# EasyEDA Pro project reference-carrier.epro, board 扩展板
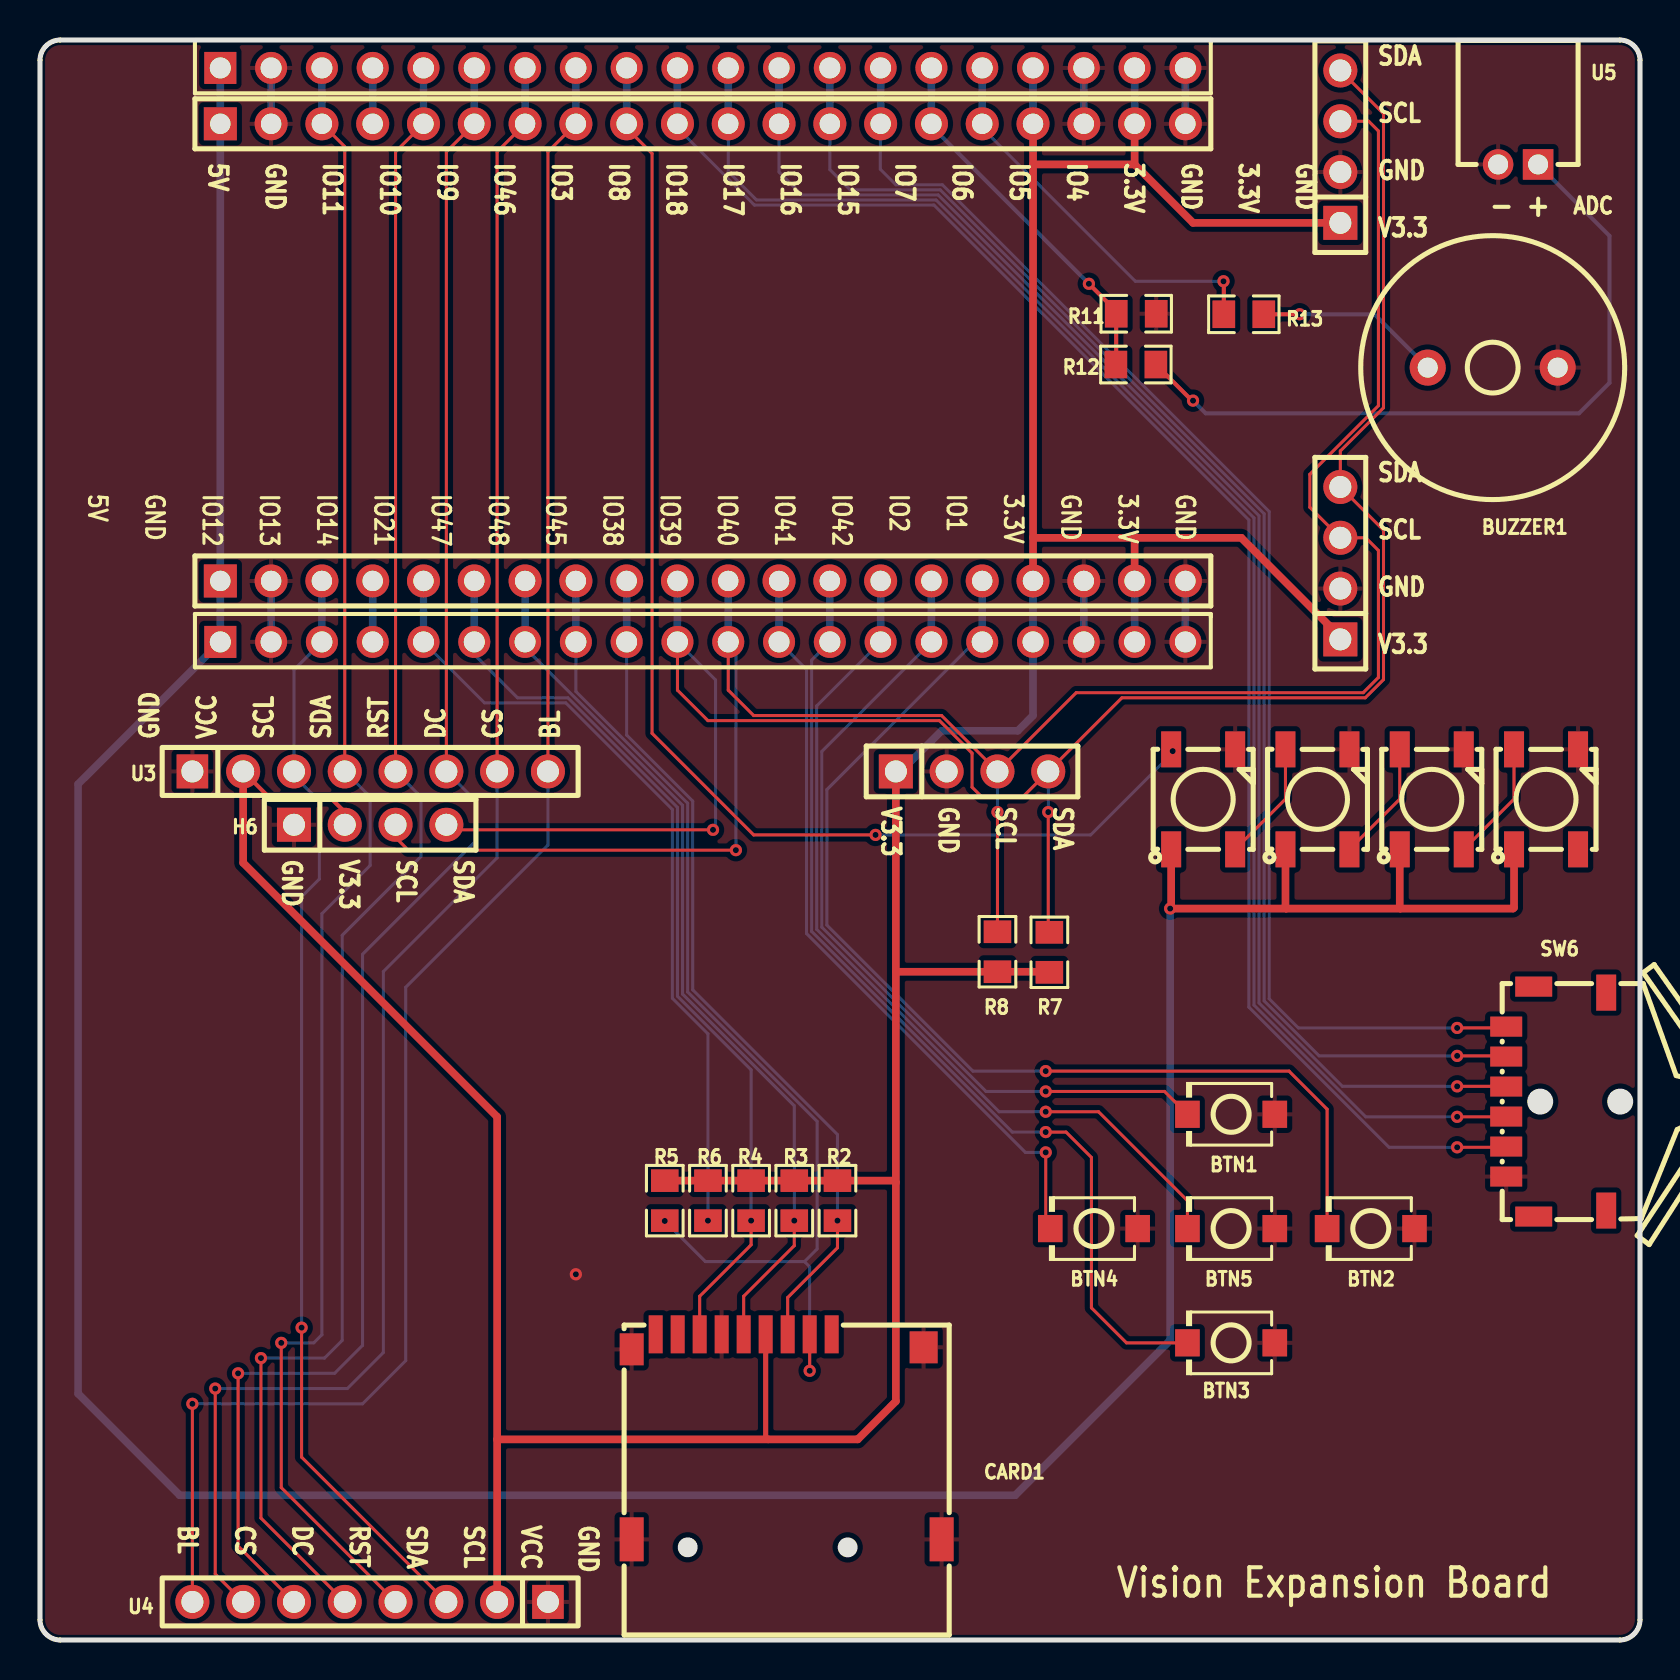
[diagram p4: board, top side]
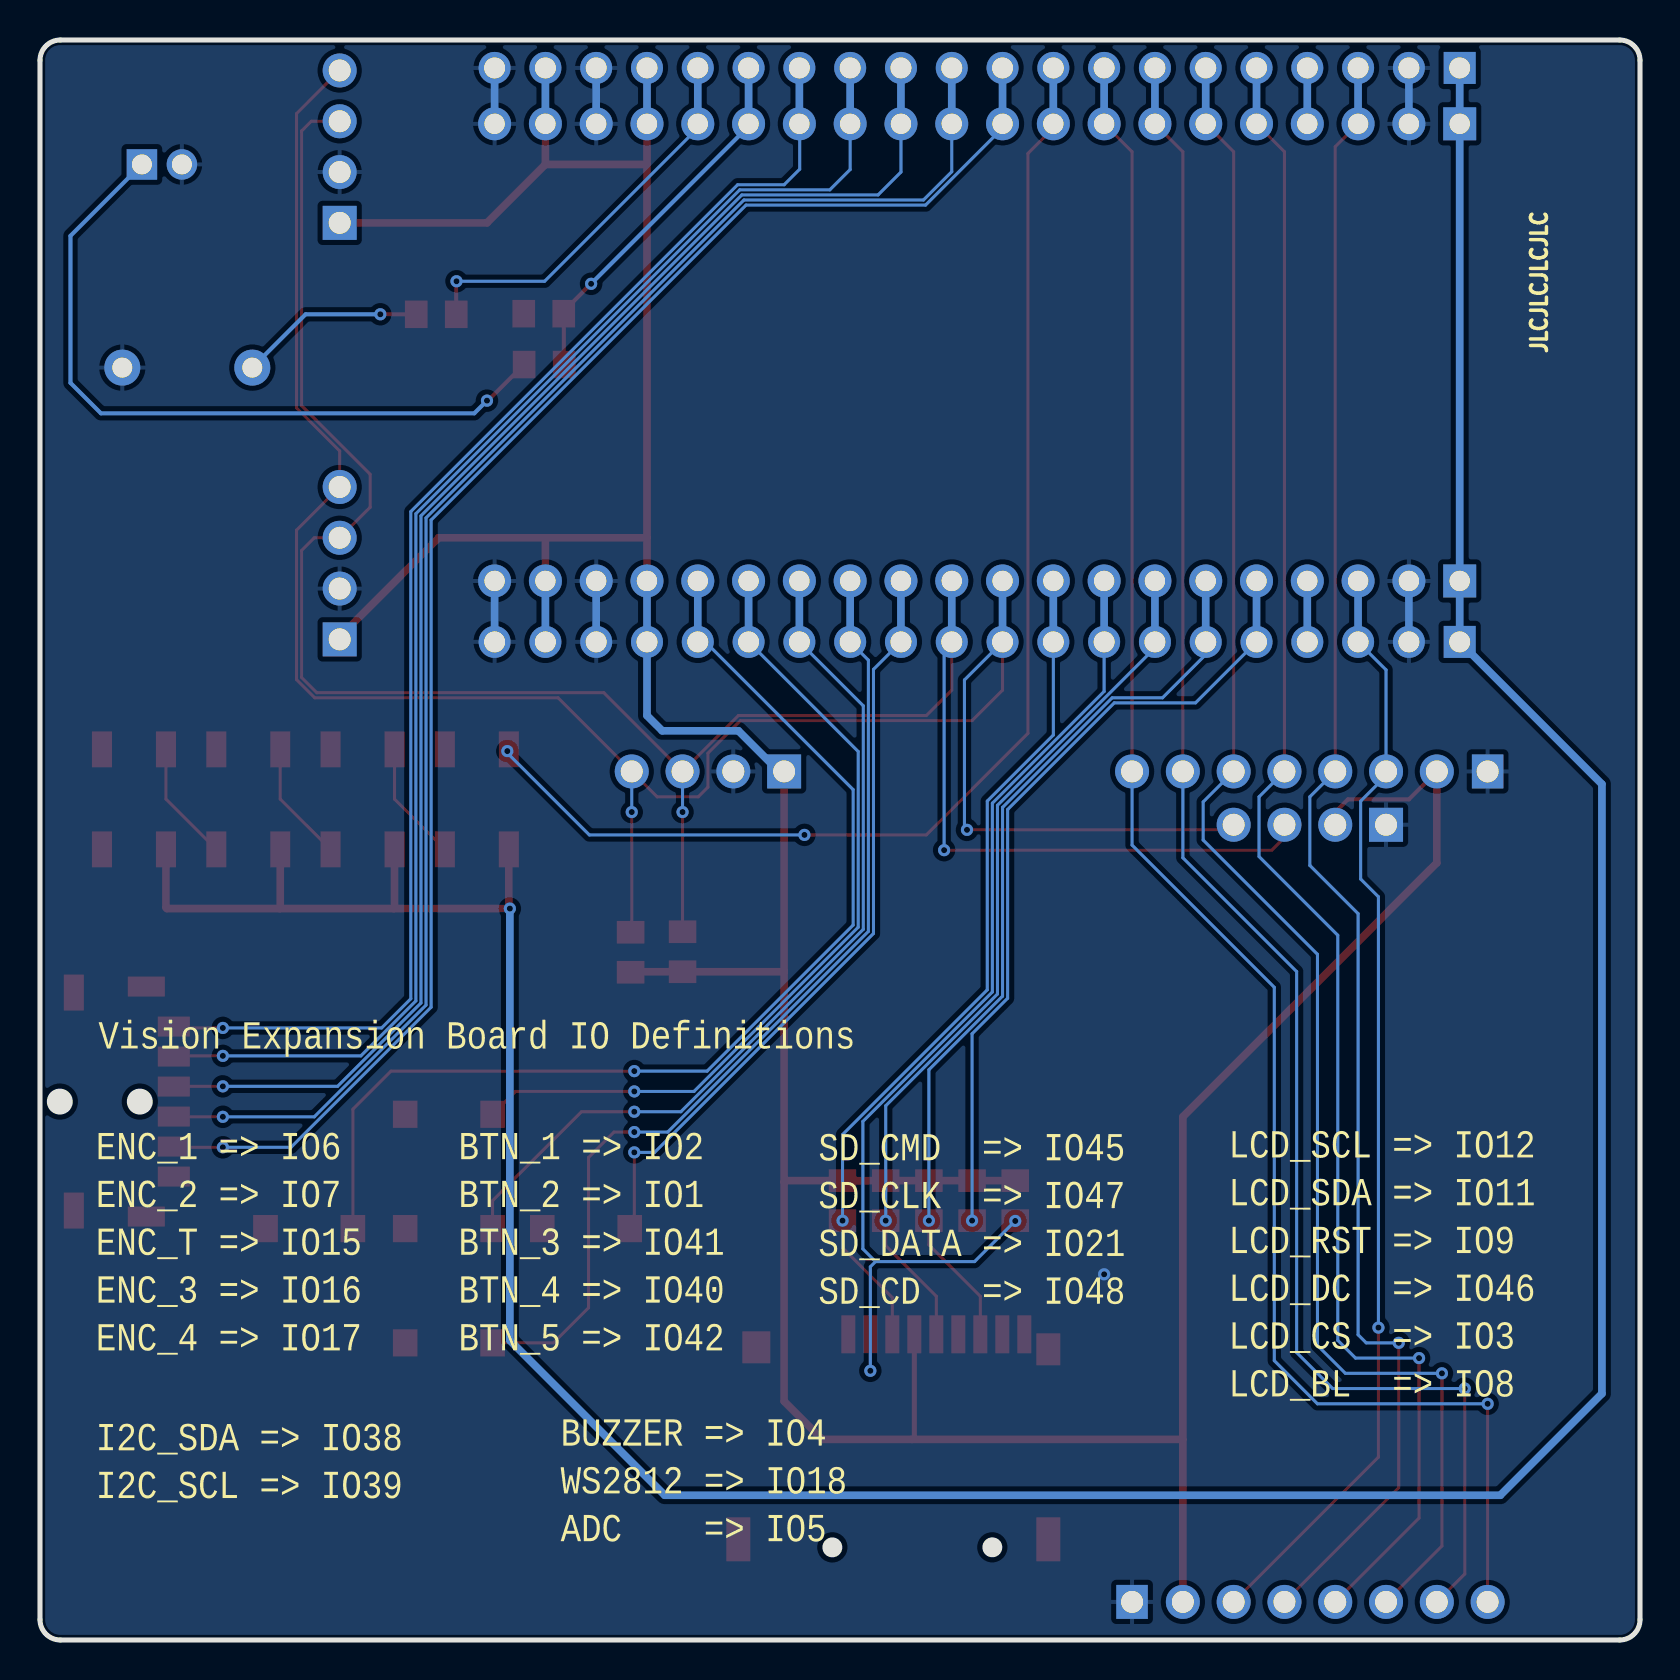
[diagram p5: board, bottom side, seen from below]

Outline 80.01 x 80.01 mm; copper layers: Top Layer, Bottom Layer. Coordinates in mm from the lower left corner of the outline.
Outline path: 0,78.99 0,1.02 arc(0.3,0.3) 1.02,0 78.99,0 arc(79.71,0.3) 80.01,1.02 80.01,78.99 arc(79.71,79.71) 78.99,80.01 1.02,80.01 arc(0.3,79.71) 0,78.99
Stack: Top Layer 0.035mm / Dielectric1 1.51mm FR4 er 4.5 / Bottom Layer 0.035mm

## Design rules (mm)
spacing copperThickness1oz (default): track to track 0.102, other pairs 0.152 to 0.3
spacing copperThickness2oz: track to track 0.203, other pairs 0.152 to 0.3
spacing Plane_innerPlane: track to track 0.102, other pairs 0.152 to 0.3
spacing Copper_copperRegion: track to track 0.102, other pairs 0.152 to 0.3
track width copperThickness1oz (default): min 0.127, default 0.254, max 2.54
track width copperThickness2oz: min 0.203, default 0.254, max 2.54
differential pair differentialPair (default): width min 0.127, default 0.254, max 2.54; gap min 0.152, default 0.152
pour e400 uses Copper_copperRegion
pour e477 uses Copper_copperRegion

## Placement (name value [footprint] x y rotation side)
BTN1  GT-TC029B-H025-L1N  [SW-SMD_L3.9-W3.0-P4.45]  59.56 26.29 180 top
BTN2  GT-TC029B-H025-L1N  [SW-SMD_L3.9-W3.0-P4.45]  66.55 20.57 180 top
BTN3  GT-TC029B-H025-L1N  [SW-SMD_L3.9-W3.0-P4.45]  59.56 14.86 180 top
BTN4  GT-TC029B-H025-L1N  [SW-SMD_L3.9-W3.0-P4.45]  52.7 20.57 180 top
BTN5  GT-TC029B-H025-L1N  [SW-SMD_L3.9-W3.0-P4.45]  59.56 20.57 180 top
BUZZER1  4000Hz  [BUZ-TH_BD12.5-P6.50-D0.9]  72.64 63.63 0 top
CARD1  MR01A-01211  [TF-SMD_MR01A-01211]  37.34 10.16 0 top
H1  B-2200S04P-A120  [HDR-TH_4P-P2.54-V-F]  65.02 53.85 90 top
H2  B-2200S04P-A120  [HDR-TH_4P-P2.54-V-F]  65.02 74.68 90 top
H3  B-2200S04P-A120  [HDR-TH_4P-P2.54-V-F]  46.61 43.43 0 top
H4  X6511WV-20H-C30D60  [HDR-TH_20P-P2.54-V-M]  33.15 78.61 0 top
H5  X6511WV-20H-C30D60  [HDR-TH_20P-P2.54-V-M]  33.15 49.91 0 top
H6  B-2200S04P-A120  [HDR-TH_4P-P2.54-V-F]  16.51 40.77 0 top
LED5  WS2812B-V5/W  [LED-SMD_4P-L5.0-W5.0-TL-1]  58.17 42.04 90 top
LED6  WS2812B-V5/W  [LED-SMD_4P-L5.0-W5.0-TL-1]  63.88 42.04 90 top
LED7  WS2812B-V5/W  [LED-SMD_4P-L5.0-W5.0-TL-1]  69.6 42.04 90 top
LED8  WS2812B-V5/W  [LED-SMD_4P-L5.0-W5.0-TL-1]  75.31 42.04 90 top
R2  10K  [R0805]  39.88 21.97 270 top
R3  10K  [R0805]  37.72 21.97 270 top
R4  10K  [R0805]  35.56 21.97 270 top
R5  10K  [R0805]  31.24 21.97 270 top
R6  10K  [R0805]  33.4 21.97 270 top
R7  10K  [R0805]  50.48 34.39 90 top
R8  10K  [R0805]  47.88 34.42 90 top
R11  100kΩ  [R0805]  54.82 66.32 0 top
R12  100kΩ  [R0805]  54.8 63.78 0 top
R13  1kΩ  [R0805]  60.2 66.29 0 top
SW6  SLLB120200  [SW-SMD_SLLB120200]  75.82 26.92 270 top
U1  PM254-1-20-Z-8.5  [HDR-TH_20P-P2.54-V-F-2]  33.15 52.96 0 top
U2  PM254-1-20-Z-8.5  [HDR-TH_20P-P2.54-V-F-2]  33.15 75.82 0 top
U3  PM254-1-08-Z-8.5  [HDR-TH_8P-P2.54-V-F]  16.51 43.43 0 top
U4  PM254-1-08-Z-8.5  [HDR-TH_8P-P2.54-V-F]  16.51 1.91 180 top
U5  HC-PH-2AW-G  [CONN-TH_2P-P2.00_HC-PH-2AW-G]  73.91 73.79 180 top

## Footprints (pads in the part's own frame, mm; a bottom-side part is the same pattern mirrored in y, then rotated)
BUZ-TH_BD12.5-P6.50-D0.9
  round 1.8 hole 1: 1(-3.25,0) 2(3.25,0)
CONN-TH_2P-P2.00_HC-PH-2AW-G
  rect 1.524x1.524 hole 1: 1(-1,0)
  round 1.524 hole 1: 2(1,0)
HDR-TH_4P-P2.54-V-F
  rect 1.7x1.7 hole 1.1: 1(-3.81,0)
  round 1.7 hole 1.1: 2(-1.27,0) 3(1.27,0) 4(3.81,0)
HDR-TH_8P-P2.54-V-F
  rect 1.575x1.7 hole 1.1: 1(-8.89,0)
  round 1.7 hole 1.1: 2(-6.35,0) 3(-3.81,0) 4(-1.27,0) 5(1.27,0) 6(3.81,0) 7(6.35,0) 8(8.89,0)
HDR-TH_20P-P2.54-V-F-2
  rect 1.65x1.65 hole 1.02: 1(-24.13,0)
  round 1.65 hole 1.02: 2(-21.59,0) 3(-19.05,0) 4(-16.51,0) 5(-13.97,0) 6(-11.43,0) 7(-8.89,0) 8(-6.35,0) 9(-3.81,0) 10(-1.27,0) 11(1.27,0) 12(3.81,0) 13(6.35,0) 14(8.89,0) 15(11.43,0) 16(13.97,0) 17(16.51,0) 18(19.05,0) 19(21.59,0) 20(24.13,0)
HDR-TH_20P-P2.54-V-M
  rect 1.6x1.6 hole 1.05: 1(-24.13,0)
  round 1.6 hole 1.05: 2(-21.59,0) 3(-19.05,0) 4(-16.51,0) 5(-13.97,0) 6(-11.43,0) 7(-8.89,0) 8(-6.35,0) 9(-3.81,0) 10(-1.27,0) 11(1.27,0) 12(3.81,0) 13(6.35,0) 14(8.89,0) 15(11.43,0) 16(13.97,0) 17(16.51,0) 18(19.05,0) 19(21.59,0) 20(24.13,0)
LED-SMD_4P-L5.0-W5.0-TL-1
  rect 1.8x1 smd: 1(-2.5,1.6) 2(-2.5,-1.6) 3(2.5,-1.6) 4(2.5,1.6)
R0805
  rect 1.133x1.377 smd: 1(-1,0) 2(1,0)
SW-SMD_L3.9-W3.0-P4.45
  rect 1.23x1.36 smd: 1(-2.185,0) 2(2.185,0)
SW-SMD_SLLB120200
  rect 1x1.6 smd: 1(-3.75,-2.5) 2(-2.25,-2.5) 3(0.75,-2.5) 4(2.25,-2.5) C(3.75,-2.5) T(-0.75,-2.5)
  rect 1x1.85 smd: 5(5.75,-1.125) 8(-5.75,-1.125)
  rect 1.8x1 smd: 6(5.45,2.5) 7(-5.45,2.5)
TF-SMD_MR01A-01211
  rect 0.7x1.9 smd: 1(2.25,5.125) 2(1.15,5.125) 3(0.05,5.125) 4(-1.05,5.125) 5(-2.15,5.125) 6(-3.25,5.125) 7(-4.35,5.125) 8(-5.45,5.125) 9(-6.55,5.125)
  rect 1.2x1.6 smd: 10(-7.75,4.375)
  rect 1.2x2.2 smd: 11(-7.75,-5.125) 12(7.75,-5.125)
  rect 1.4x1.6 smd: 13(6.85,4.475)

## Nets
As in the schematic.

Pads without a net: CARD1 1 8 9; LED8 2; SW6 5 6 7 8

## Via types
v1: diameter 0.61, hole 0.305, Top Layer to Bottom Layer, 34 vias

## Routing (per net, layer and track width the routed paths; a pad name or vN(x,y) marks a point on that pad's centre or on a via; arc(x,y) is an arc through that point)
GND: length 17.5
  Bottom Layer w0.381: H4.18 U2.18 ; H4.2 U2.2 ; H4.20 U2.20 ; H5.2 U1.2 ; U1.18 H5.18 ; U1.20 H5.20
  vias: v1(26.8,18.29)
V3.3: length 214.7
  Top Layer w0.203: U3.2 11.56,42.04 14.6,42.04 15.24,41.4 H6.2
  Top Layer w0.254: CARD1.4 36.29,10.16 36.41,10.03
  Top Layer w0.381: U2.17 49.66,73.79 ; 49.66,73.79 54.74,73.79 ; 49.66,73.79 49.66,55.12 ; 42.8,33.42 R8.1 50.45,33.42 R7.1 ; 42.8,33.42 42.8,43.43 ; 42.8,33.42 42.8,22.89 ; 22.86,10.03 22.86,26.16 10.16,38.86 U3.2 ; 22.86,10.03 U4.2 ; 22.86,10.03 40.89,10.03 42.8,11.94 42.8,22.89 ; 54.74,55.12 49.66,55.12 ; 54.74,55.12 U1.19 ; 54.74,55.12 60.07,55.12 65.02,50.16 H1.1 ; 49.66,55.12 U1.17 ; 42.8,22.89 42.72,22.97 R2.1 R3.1 R4.1 R6.1 R5.1 ; U2.19 54.74,73.79 ; 54.74,73.79 57.66,70.87 H2.1
  Bottom Layer w0.381: U2.17 H4.17 ; U1.19 H5.19 ; H4.19 U2.19 ; U1.17 H5.17 49.66,46.23 48.89,45.47 45.08,45.47 43.05,43.43 42.8,43.43
V5: length 179.8
  Top Layer w0.381: 68.03,36.58 68,36.61 LED7.1 ; 68.03,36.58 62.31,36.58 ; 68.03,36.58 73.66,36.58 73.71,36.63 LED8.1 ; 62.31,36.58 62.28,36.61 LED6.1 ; 62.31,36.58 v1(56.51,36.58) 56.57,36.63 LED5.1
  Bottom Layer w0.381: H4.1 U2.1 U1.1 H5.1 1.9,42.8 1.9,12.32 6.98,7.24 48.77,7.24 56.51,14.99 v1(56.51,36.58)
BAT+: length 36.7
  Top Layer w0.203: v1(57.66,61.98) 57.61,61.98 R12.2
  Bottom Layer w0.203: U5.1 78.49,70.21 78.49,62.86 76.96,61.34 58.29,61.34 v1(57.66,61.98)
ENC_1: length 68.5
  Top Layer w0.152: v1(70.87,30.61) 73.25,30.61 SW6.1
  Bottom Layer w0.152: v1(70.87,30.61) 62.93,30.61 61.47,32.07 61.47,56.43 45.12,72.77 42.8,72.77 42.02,73.55 42.02,75.8 U2.14
  Bottom Layer w0.381: H4.14 U2.14
ENC_2: length 71.5
  Top Layer w0.152: v1(70.87,29.21) 73.28,29.21 SW6.2
  Bottom Layer w0.152: v1(70.87,29.21) 63.96,29.21 61.21,31.96 61.21,56.32 45.02,72.52 40.51,72.52 39.5,73.53 U2.13
  Bottom Layer w0.381: H4.13 U2.13
ENC_3: length 77.9
  Top Layer w0.152: v1(70.87,26.16) 73.31,26.16 SW6.3
  Bottom Layer w0.152: v1(70.87,26.16) 66.29,26.16 60.71,31.75 60.71,56.11 44.81,72.01 35.83,72.01 34.42,73.42 U2.11
  Bottom Layer w0.381: U2.11 H4.11
ENC_4: length 79.8
  Top Layer w0.152: SW6.4 73.28,24.64 v1(70.87,24.64)
  Bottom Layer w0.152: v1(70.87,24.64) 67.46,24.64 60.45,31.64 60.45,56.01 44.7,71.75 35.72,71.75 31.88,75.6 U2.10
  Bottom Layer w0.381: H4.10 U2.10
ENC_T: length 74.8
  Top Layer w0.152: v1(70.87,27.69) 73.31,27.69 SW6.T
  Bottom Layer w0.152: v1(70.87,27.69) 65.13,27.69 60.96,31.85 60.96,56.22 44.91,72.26 38.1,72.26 36.96,73.41 U2.12
  Bottom Layer w0.381: H4.12 U2.12
I2C_SCL: length 111.1
  Top Layer w0.152: H2.3 66.44,75.95 66.93,75.46 66.93,61.72 63.5,58.29 63.5,56.64 H1.3 66.29,55.12 66.93,54.48 66.93,48.13 66.17,47.37 51.82,47.37 H3.3 45.08,46.23 35.69,46.23 34.42,47.5 H5.11 ; R8.2 v1(47.88,41.4) ; v1(34.8,39.5) 18.41,39.5 17.78,40.13 H6.3
  Bottom Layer w0.152: v1(34.8,39.5) 34.8,49.53 H5.11 ; v1(47.88,41.4) H3.3
  Bottom Layer w0.381: U1.11 H5.11
I2C_SDA: length 111.3
  Top Layer w0.152: R7.2 50.42,35.45 v1(50.42,41.4) ; H5.10 31.88,47.5 33.4,45.97 44.98,45.97 46.61,44.34 46.61,42.65 47.09,42.16 49.15,42.16 H3.4 54.1,47.12 66.27,47.12 67.18,48.03 67.18,55.5 H1.4 65.02,59.46 67.18,61.62 67.18,76.33 H2.4 ; v1(33.66,40.51) 20.57,40.51 H6.4
  Bottom Layer w0.152: v1(50.42,41.4) H3.4 ; v1(33.66,40.51) 33.78,40.64 33.78,48.01 H5.10
  Bottom Layer w0.381: H5.10 U1.10
IO1: length 55.4
  Top Layer w0.152: BTN2.2 64.36,26.54 62.46,28.45 v1(50.29,28.45)
  Bottom Layer w0.152: v1(50.29,28.45) 46.65,28.45 39.35,35.75 39.35,42.52 46.74,49.91 H5.16
  Bottom Layer w0.381: U1.16 H5.16
IO2: length 41.7
  Top Layer w0.152: BTN1.2 56.23,27.43 v1(50.29,27.43)
  Bottom Layer w0.152: v1(50.29,27.43) 47.31,27.43 39.09,35.64 39.09,44.43 H5.15
  Bottom Layer w0.381: U1.15 H5.15
IO3: length 87.6
  Top Layer w0.152: U4.7 8.76,3.3 v1(8.76,12.57) ; U3.7 22.86,74.42 U2.7
  Bottom Layer w0.152: U3.7 22.86,39.12 17.17,33.43 17.17,14.38 15.37,12.57 v1(8.76,12.57)
  Bottom Layer w0.381: U2.7 H4.7
IO4: length 19.9
  Top Layer w0.203: R13.1 59.2,67.93 v1(59.18,67.94)
  Bottom Layer w0.152: U2.16 47.12,75.6 54.78,67.94 v1(59.18,67.94)
  Bottom Layer w0.381: H4.16 U2.16
IO5: length 18.7
  Top Layer w0.203: v1(52.45,67.82) 53.82,66.45 R11.1 53.82,63.8 R12.1
  Bottom Layer w0.203: U2.15 44.58,75.69 v1(52.45,67.82)
  Bottom Layer w0.381: H4.15 U2.15
IO8: length 89.6
  Top Layer w0.152: U3.8 25.4,74.42 U2.8 ; v1(7.62,11.81) U4.8
  Bottom Layer w0.152: U3.8 25.4,39.75 18.29,32.64 18.29,13.97 16.13,11.81 v1(7.62,11.81)
  Bottom Layer w0.381: H4.8 U2.8
IO9: length 84.7
  Top Layer w0.152: U3.5 17.78,74.42 U2.5 ; v1(11.05,14.1) 11.05,6.1 U4.5
  Bottom Layer w0.152: v1(11.05,14.1) 14.22,14.1 15.11,14.99 15.11,35.24 19.05,39.18 19.05,42.16 U3.5
  Bottom Layer w0.381: U2.5 H4.5
IO10: length 2.8
  Bottom Layer w0.381: H4.4 U2.4
IO11: length 82.9
  Top Layer w0.152: U2.3 15.24,74.68 U3.4 ; v1(12.06,14.86) 12.06,7.62 U4.4
  Bottom Layer w0.152: v1(12.06,14.86) 13.69,14.86 14.1,15.27 14.1,36.32 16.51,38.73 16.51,42.16 U3.4
  Bottom Layer w0.381: U2.3 H4.3
IO12: length 55.5
  Top Layer w0.152: v1(13.08,15.62) 13.08,9.14 U4.3
  Bottom Layer w0.152: v1(13.08,15.62) 13.08,37.16 13.97,38.05 13.97,41.95 12.7,43.22 U3.3 12.7,48.51 H5.3
  Bottom Layer w0.381: U1.3 H5.3
IO13: length 3
  Bottom Layer w0.381: H5.4 U1.4
IO14: length 40.3
  Bottom Layer w0.152: H5.5 22.22,46.86 26.29,46.86 31.62,41.53 31.62,32.09 33.4,30.31 v1(33.4,20.97)
  Bottom Layer w0.381: U1.5 H5.5
IO18: length 63.9
  Top Layer w0.152: U2.9 29.34,75.6 30.61,74.33 30.61,45.34 35.69,40.26 v1(41.78,40.26)
  Bottom Layer w0.152: 56.64,44.58 56.64,44.36 52.54,40.26 v1(41.78,40.26)
  Bottom Layer w0.381: U2.9 H4.9
  vias: v1(56.64,44.45)
IO21: length 45.9
  Top Layer w0.152: v1(35.56,20.97) 35.56,19.76 32.99,17.19 CARD1.7
  Bottom Layer w0.152: v1(35.56,20.97) 35.56,28.51 31.88,32.2 31.88,41.63 26.39,47.12 23.88,47.12 21.72,49.28 H5.6
  Bottom Layer w0.381: H5.6 U1.6
IO40: length 38.6
  Top Layer w0.152: v1(50.29,24.38) 50.29,20.8 BTN4.2
  Bottom Layer w0.152: H5.12 38.33,48.54 38.33,35.33 49.28,24.38 v1(50.29,24.38)
  Bottom Layer w0.381: U1.12 H5.12
IO41: length 49.6
  Top Layer w0.152: v1(50.29,25.4) 51.31,25.4 52.58,24.13 52.58,16.61 54.33,14.86 BTN3.2
  Bottom Layer w0.152: H5.13 38.58,49 38.58,35.43 48.62,25.4 v1(50.29,25.4)
  Bottom Layer w0.381: U1.13 H5.13
IO42: length 44.3
  Top Layer w0.152: v1(50.29,26.42) 52.93,26.42 57.38,21.97 BTN5.2
  Bottom Layer w0.152: H5.14 38.84,46.71 38.84,35.54 47.96,26.42 v1(50.29,26.42)
  Bottom Layer w0.381: U1.14 H5.14
IO45: length 43.1
  Top Layer w0.152: CARD1.3 37.39,17.12 39.88,19.61 v1(39.88,20.97)
  Bottom Layer w0.152: H5.9 29.34,45.25 32.64,41.95 32.64,32.51 39.88,25.27 v1(39.88,20.97)
  Bottom Layer w0.381: U1.9 H5.9
IO46: length 86.8
  Top Layer w0.152: U2.6 20.32,74.42 U3.6 ; v1(9.91,13.33) 9.91,4.7 U4.6
  Bottom Layer w0.152: v1(9.91,13.33) 14.73,13.33 16.13,14.73 16.13,34.29 21.84,40 21.84,41.91 U3.6
  Bottom Layer w0.381: H4.6 U2.6
IO47: length 44.3
  Top Layer w0.152: CARD1.5 35.19,17.19 37.72,19.72 v1(37.72,20.97)
  Bottom Layer w0.152: H5.7 24.26,49.61 32.13,41.74 32.13,32.3 37.72,26.71 v1(37.72,20.97)
  Bottom Layer w0.381: U1.7 H5.7
IO48: length 54.5
  Top Layer w0.152: CARD1.2 v1(38.49,13.46)
  Bottom Layer w0.152: 38.23,18.92 38.49,18.66 v1(38.49,13.46) ; 38.23,18.92 33.27,18.92 v1(31.24,20.95) ; 38.23,18.92 38.86,19.56 38.86,25.93 32.39,32.41 32.39,41.84 26.8,47.43 H5.8
  Bottom Layer w0.381: H5.8 U1.8
$1N855: length 6
  Top Layer w0.152: LED5.2 62.28,42.05 LED6.4
$1N863: length 6
  Top Layer w0.152: LED7.4 68,42.05 LED6.2
$1N934: length 6
  Top Layer w0.152: LED8.4 73.71,42.05 LED7.2
$1N5497: length 9.3
  Top Layer w0.203: R13.2 v1(62.99,66.29)
  Bottom Layer w0.203: BUZZER1.1 66.73,66.29 v1(62.99,66.29)

## Copper pours and planes (outline as drawn; the poured copper is in the pictures)
GND on Top Layer: -6.48,87.88 95,87.88 95,-21.72 -6.48,-21.72
GND on Bottom Layer: -16.26,96.27 89.28,96.27 89.28,-11.3 -16.26,-11.3

## Text on the board
Bottom Silkscreen Layer: JLCJLCJLCJLC | LCD_SCL => IO12 / LCD_SDA => IO11 / LCD_RST => IO9 / LCD_DC  => IO46 / LCD_CS  => IO3 / LCD_BL  => IO8 | SD_CMD  => IO45 / SD_CLK  => IO47 / SD_DATA => IO21 / SD_CD   => IO48 | BUZZER => IO4 / WS2812 => IO18 / ADC    => IO5 | BTN_1 => IO2 / BTN_2 => IO1 / BTN_3 => IO41 / BTN_4 => IO40 / BTN_5 => IO42 | Vision Expansion Board IO Definitions | ENC_1 => IO6 / ENC_2 => IO7 / ENC_T => IO15 / ENC_3 => IO16 / ENC_4 => IO17 | I2C_SDA => IO38 / I2C_SCL => IO39
Top Silkscreen Layer: ADC | GND / 3.3V / GND / 3.3V / IO1 / IO2 / IO42 / IO41 / IO40 / IO39 / IO38 / IO45 / IO48 / IO47 / IO21 / IO14 / IO13 / IO12 / GND / 5V | SDA / SCL / GND / V3.3 | GND / VCC / SCL / SDA / RST / DC / CS / BL | GND / 3.3V / GND / 3.3V / IO4 / IO5 / IO6 / IO7 / IO15 / IO16 / IO17 / IO18 / IO8 / IO3 / IO46 / IO9 / IO10 / IO11 / GND / 5V | SDA / SCL / V3.3 / GND | - + | Vision Expansion Board
